# EAGLE design ComparatorLickDet_Alpha1b (EAGLE 9.6.2)
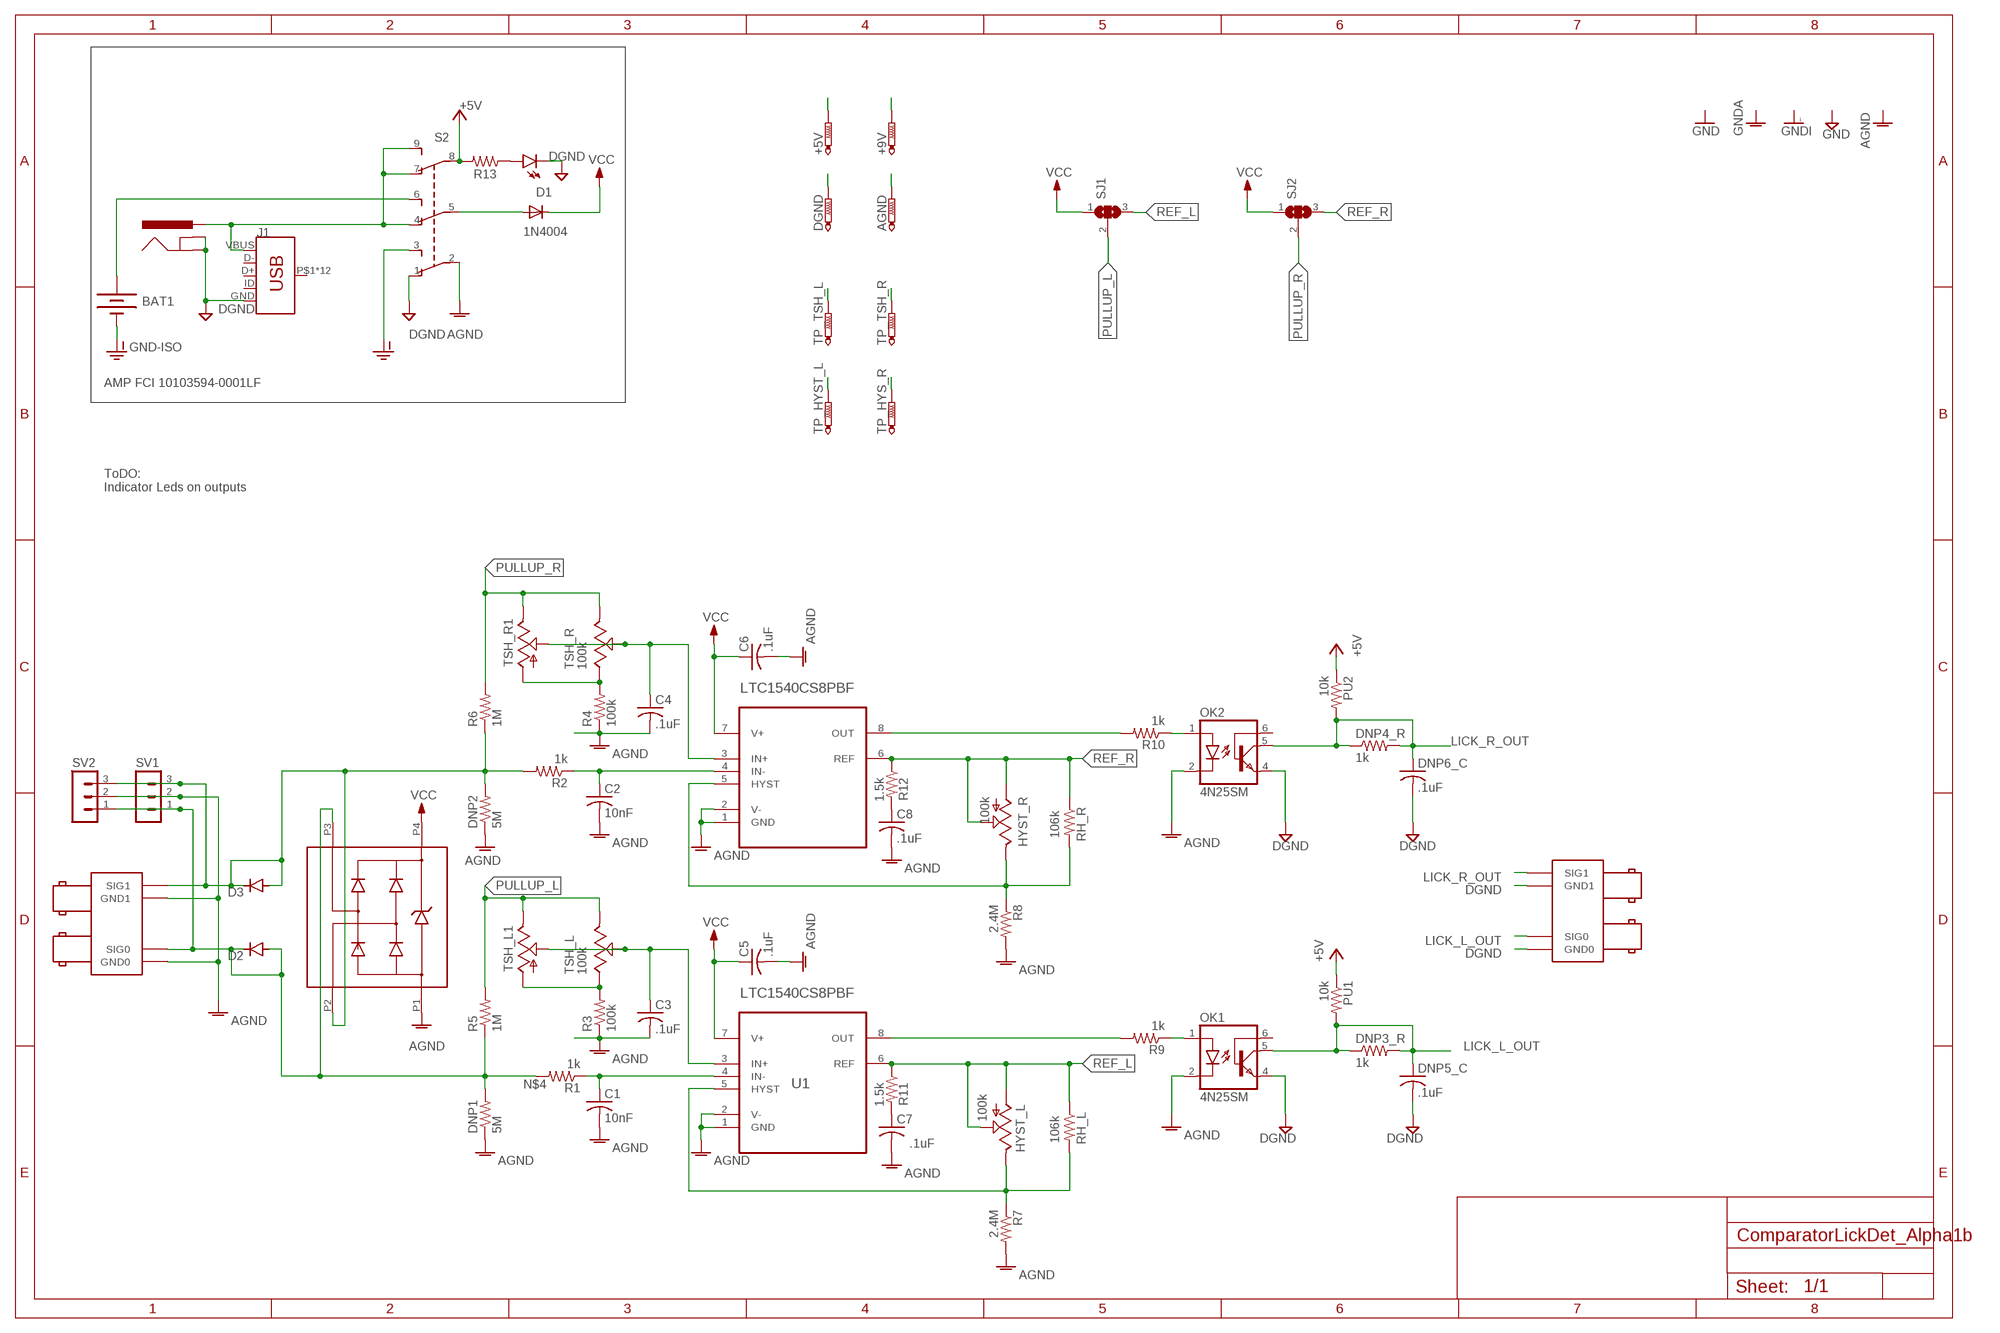
[diagram p0: schematic, sheet 1]

## Parts
+5V  PTR1PAD1-13Y  [P1-13Y]
+9V  PTR1PAD1-13Y  [P1-13Y]
AGND  PTR1PAD1-13Y  [P1-13Y]
BAT1  BATTERY9V  [BATTCON_9V]
C1  10nF  C-USC0805  [C0805]
C2  10nF  C-USC0805  [C0805]
C3  .1uF  C-USC0805  [C0805]
C4  .1uF  C-USC0805  [C0805]
C5  .1uF  C-USC0805  [C0805]
C6  .1uF  C-USC0805  [C0805]
C7  .1uF  C-USC0805  [C0805]
C8  .1uF  C-USC0805  [C0805]
D1  1N4004  [DO41-10]
D2  DIODE-D-2.5  [D-2.5]
D3  DIODE-D-2.5  [D-2.5]
DGND  PTR1PAD1-13Y  [P1-13Y]
DNP1  5M  R-US_M0805  [M0805]
DNP2  5M  R-US_M0805  [M0805]
DNP3_R  1k  R-US_M0805  [M0805]
DNP4_R  1k  R-US_M0805  [M0805]
DNP5_C  .1uF  C-USC0805  [C0805]
DNP6_C  .1uF  C-USC0805  [C0805]
HYST_L  100k  TRIM_US-B25P  [B25P]
HYST_R  100k  TRIM_US-B25P  [B25P]
J1  AMP FCI 10103594-0001LF  USB_MICRO-B_HALF_PTH  [USB-MICROB-PTH]
JP10  POWER_JACKPTH_BREAD  [POWER_JACK_PTH_BREAD]
LICKS_IN  BNC_RIGHT_ANGLE_DOUBLE  [BNC_RIGHT_ANGLE_DOUBLE]
LICKS_OUT  BNC_RIGHT_ANGLE_DOUBLE  [BNC_RIGHT_ANGLE_DOUBLE]
OK1  4N25SM  [DIL6-SMD]
OK2  4N25SM  [DIL6-SMD]
PU1  10k  R-US_M0805  [M0805]
PU2  10k  R-US_M0805  [M0805]
PWR  LED3MM  [LED3MM]
R1  1k  R-US_M0805  [M0805]
R2  1k  R-US_M0805  [M0805]
R3  100k  R-US_M0805  [M0805]
R4  100k  R-US_M0805  [M0805]
R5  1M  R-US_M0805  [M0805]
R6  1M  R-US_M0805  [M0805]
R7  2.4M  R-US_M0805  [M0805]
R8  2.4M  R-US_M0805  [M0805]
R9  1k  R-US_M0805  [M0805]
R10  1k  R-US_M0805  [M0805]
R11  1.5k  R-US_M0805  [M0805]
R12  1.5k  R-US_M0805  [M0805]
R13  330  R-US_R0805  [R0805]
RH_L  106k  R-US_M0805  [M0805]
RH_R  106k  R-US_M0805  [M0805]
S2  SWITCH-3PDT-TH-V  [NKK-M20-9PIN-VERTICAL]
SJ1  SJ2W  [SJ_2]
SJ2  SJ2W  [SJ_2]
SV1  MA03-1  [MA03-1]
SV2  MA03-1  [MA03-1]
TP_HYS_R  PTR1PAD1-13  [P1-13]
TP_HYST_L  PTR1PAD1-13  [P1-13]
TP_TSH_L  PTR1PAD1-13  [P1-13]
TP_TSH_R  PTR1PAD1-13  [P1-13]
TSH_L  100k  3590S-2-103L  [TRIM_3590S-2-103L]
TSH_L1  100k  TRIM_US-B25P  [B25P]
TSH_R  100k  3590S-2-103L  [TRIM_3590S-2-103L]
TSH_R1  100k  TRIM_US-B25P  [B25P]
U1  LTC1540CS8PBF  [SOIC127P600X175-8N]
U2  LTC1540CS8PBF  [SOIC127P600X175-8N]
U3  CD143A-12_TVS  [SOT-143]

## Nets
+5V: +5V.TP PU1.1 PU2.1 R13.2 S2.8(P3)
+9V: +9V.TP BAT1.+ S2.6(S2)
AGND: AGND.TP C1.2 C2.2 C3.2 C4.2 C5.2 C6.2 C7.2 C8.2 DNP1.1 DNP2.1 LICKS_IN.P$GND0(GND0) LICKS_IN.P$GND1(GND1) OK1.2(C) OK2.2(C) R3.1 R4.1 R7.2 R8.2 S2.2(P1) SV1.2 SV2.2 U1.1(GND) U1.2(V-) U2.1(GND) U2.2(V-) U3.P1
DGND: DGND.TP DNP5_C.2 DNP6_C.2 J1.GND JP10.GND JP10.GNDBREAK LICKS_OUT.P$GND0(GND0) LICKS_OUT.P$GND1(GND1) OK1.4(EMI) OK2.4(EMI) PWR.K(C) S2.1(O1) ; supply symbol labelled GND
GND-ISO: BAT1.- S2.3(S1)
HYST_L: HYST_L.E R7.1 RH_L.2 TP_HYST_L.TP U1.5(HYST)
HYST_R: HYST_R.E R8.1 RH_R.2 TP_HYS_R.TP U2.5(HYST)
LICK_L_IN: C1.1 R1.1 U1.4(IN-)
LICK_L_OUT: DNP3_R.1 DNP3_R.2 DNP5_C.1 LICKS_OUT.P$SIG0(SIG0) OK1.5(COL) PU1.2
LICK_R_OUT: DNP4_R.1 DNP4_R.2 DNP6_C.1 LICKS_OUT.P$SIG1(SIG1) OK2.5(COL) PU2.2
N$2: R3.2 TSH_L1.A TSH_L.1(CCW)
N$4: D2.A D2.C DNP1.2 LICKS_IN.P$SIG0(SIG0) R1.2 R5.1 SV1.1 SV2.1 U3.P3
N$6: J1.VBUS JP10.PWR S2.4(O2) S2.7(O3) S2.9(S3)
N$7: C7.1 R11.2
N$8: R4.2 TSH_R1.A TSH_R.1(CCW)
N$9: C2.1 R2.1 U2.4(IN-)
N$10: C8.1 R12.2
N$11: D3.A D3.C DNP2.2 LICKS_IN.P$SIG1(SIG1) R2.2 R6.1 SV1.3 SV2.3 U3.P2
N$21: PWR.A R13.1
N$26: OK1.1(A) R9.1
N$31: R9.2 U1.8(OUT)
N$46: OK2.1(A) R10.1
N$47: R10.2 U2.8(OUT)
PULLUP_L: R5.2 SJ1.2 TSH_L1.E TSH_L.3(CW)
PULLUP_R: R6.2 SJ2.2 TSH_R1.E TSH_R.3(CW)
REF_L: HYST_L.A HYST_L.S R11.1 RH_L.1 SJ1.3 U1.6(REF)
REF_R: HYST_R.A HYST_R.S R12.1 RH_R.1 SJ2.3 U2.6(REF)
TSH_L: C3.1 TP_TSH_L.TP TSH_L1.S TSH_L.2(WIPER) U1.3(IN+)
TSH_R: C4.1 TP_TSH_R.TP TSH_R1.S TSH_R.2(WIPER) U2.3(IN+)
VCC: C5.1 C6.1 D1.C SJ1.1 SJ2.1 U1.7(V+) U2.7(V+) U3.P4
VIN: D1.A S2.5(P2)
Unconnected: J1.D+ J1.D- J1.ID J1.P$1(SHIELD) J1.P$2(SHIELD) J1.P$3(SHIELD) J1.P$4(SHIELD) J1.P$6(SHIELD) J1.P$8(SHIELD) J1.P$10(SHIELD) J1.P$12(SHIELD) J1.SHEILD2(SHIELD) J1.SHIELD J1.SHIELD3(SHIELD) J1.SHIELD4(SHIELD) OK1.6(BAS) OK2.6(BAS)

## Notes on the sheet
- ToDO:
  Indicator Leds on outputs

## Library data of the parts
+5V +9V AGND DGND TP_HYS_R TP_HYST_L TP_TSH_L TP_TSH_R = testpad:PTR1: TEST PIN
BAT1 = Pavel_ElectroMechanical:BATTERY: Battery Holders Various common sizes : AA, AAA, 18650 (PRT-12895), 20mm coin cell and 12mm coin cell. 20MM_4LEGS, BATT-10373 9V Digikey BH9v-PC-ND
C1-C8 DNP6_C = adafruit:C-US: CAPACITOR, American symbol; SPICEPREFIX: C
D1 = adafruit:1N4004: DIODE General purpose 1N400x type rectifier (With bigger pads) http://www.ladyada.net/library/pcb/eaglelibrary.html
D2 D3 = diode:DIODE-: DIODE
DNP1 DNP2 DNP4_R PU2 R1-R6 R8 R10 = adafruit:R-US_: RESISTOR, American symbol; SPICEPREFIX: R
DNP3_R PU1 R7 R9 R11-R13 RH_L RH_R = adafruit:R-US_: RESISTOR, American symbol
DNP5_C = adafruit:C-US: CAPACITOR, American symbol
HYST_L TSH_L1 TSH_R1 = pot:TRIM_US-: POTENTIOMETER
HYST_R = pot:TRIM_US-: POTENTIOMETER; SPICEPREFIX: J
J1 = SparkFun-Connectors:USB_MICRO-B: USB Type Micro-B Connector Male/female and PTH/SMT variants SparkFun Products: SparkFun microB USB Breakout <https://www.sparkfun.com/products/12035> SparkFun USB microB Plug Breakout <https://www.sparkfun.com/products/10031> SparkFun ESP8266 Thing <https://www.sparkfun.com/products/13231>; PROD_ID: CONN-13711
JP10 = SparkFun-Connectors:POWER_JACK: Power Jack Connector This is the standard 5.5mm barrel jack for power. The PTH is the most common, proven, reliable, footprint. The Slot footprint only works if the mill layer is transmitted to the PCB fab house so be warned. Here are the connectors we sell at SparkFun: DC Barrel Power Jack/Connector <https://www.sparkfun.com/products/119> (PRT-00119) DC Barrel Power Jack/Connector (SMD) <https://www.sparkfun.com/products/12748> (PRT-12748) DC Barrel Jack Adapter - Breadboard Compatible <https://www.sparkfun.com/products/10811> (PRT-10811) It is used on this SparkFun product (and many, many others): SparkFun RedBoard - Programmed with Arduino <https://www.sparkfun.com/products/12757> (DEV-12757) Also, if you need a mating power supply or connector, please check these out: Wall Adapter Power Supply - 9VDC 650mA <https://www.sparkfun.com/products/298> (TOL-00298) DC Barrel Jack Adapter - Male <https://www.sparkfun.com/products/10287> (PRT-10287); PROD_ID: PRT-10811
LICKS_IN LICKS_OUT = Pavel_Connectors:BNC_RIGHT_ANGLE_DOUBLE
OK1 = optocoupler:4N*?M: General Purpose 6-Pin Phototransistor Optocouplers Source: http://www.fairchildsemi.com/ds/4N/4N35-M.pdf; MF: FAIRCHILD SEMICONDUCTOR; MPN: 4N25SM; OC_FARNELL: 1021152; OC_NEWARK: 34C2020
OK2 = optocoupler:4N*?M: General Purpose 6-Pin Phototransistor Optocouplers Source: http://www.fairchildsemi.com/ds/4N/4N35-M.pdf; MF: FAIRCHILD SEMICONDUCTOR; MPN: 4N25SM; OC_FARNELL: 1021152; OC_NEWARK: 34C2020; SPICEPREFIX: X
PWR = led:LED: LED OSRAM: - CHIPLED LG R971, LG N971, LY N971, LG Q971, LY Q971, LO R971, LY R971 LH N974, LH R974 LS Q976, LO Q976, LY Q976 LO Q996 - Hyper CHIPLED LW Q18S LB Q993, LB Q99A, LB R99A - SideLED LS A670, LO A670, LY A670, LG A670, LP A670 LB A673, LV A673, LT A673, LW A673 LH A674 LY A675 LS A676, LA A676, LO A676, LY A676, LW A676 LS A679, LY A679, LG A679 - Hyper Micro SIDELED® LS Y876, LA Y876, LO Y876, LY Y876 LT Y87S - SmartLED LW L88C, LW L88S LB L89C, LB L89S, LG L890 LS L89K, LO L89K, LY L89K LS L896, LA L896, LO L896, LY L896 - TOPLED LS T670, LO T670, LY T670, LG T670, LP T670 LSG T670, LSP T670, LSY T670, LOP T670, LYG T670 LG T671, LOG T671, LSG T671 LB T673, LV T673, LT T673, LW T673 LH T674 LS T676, LA T676, LO T676, LY T676, LB T676, LH T676, LSB T676, LW T676 LB T67C, LV T67C, LT T67C, LS T67K, LO T67K, LY T67K, LW E67C LS E67B, LA E67B, LO E67B, LY E67B, LB E67C, LV E67C, LT E67C LW T67C LS T679, LY T679, LG T679 LS T770, LO T770, LY T770, LG T770, LP T770 LB T773, LV T773, LT T773, LW T773 LH T774 LS E675, LA E675, LY E675, LS T675 LS T776, LA T776, LO T776, LY T776, LB T776 LHGB T686 LT T68C, LB T68C - Hyper Mini TOPLED® LB M676 - Mini TOPLED Santana® LG M470 LS M47K, LO M47K, LY M47K Source: http://www.osram.convergy.de LUXEON: - LUMILED® LXK2-PW12-R00, LXK2-PW12-S00, LXK2-PW14-U00, LXK2-PW14-V00 LXK2-PM12-R00, LXK2-PM12-S00, LXK2-PM14-U00 LXK2-PE12-Q00, LXK2-PE12-R00, LXK2-PE12-S00, LXK2-PE14-T00, LXK2-PE14-U00 LXK2-PB12-K00, LXK2-PB12-L00, LXK2-PB12-M00, LXK2-PB14-N00, LXK2-PB14-P00, LXK2-PB14-Q00 LXK2-PR12-L00, LXK2-PR12-M00, LXK2-PR14-Q00, LXK2-PR14-R00 LXK2-PD12-Q00, LXK2-PD12-R00, LXK2-PD12-S00 LXK2-PH12-R00, LXK2-PH12-S00 LXK2-PL12-P00, LXK2-PL12-Q00, LXK2-PL12-R00 Source: www.luxeon.com KINGBRIGHT: KA-3528ASYC Source: www.kingbright.com
S2 = Pavel_ElectroMechanical:SWITCH-3PDT-TH-V: 3PDT 9 pin footswitch SF17020F-0302-21R-L Source: 3PDT.jpg
SJ1 SJ2 = jumper:SJ2W: SMD solder JUMPER
SV1 SV2 = con-lstb:MA03-1: PIN HEADER; OC_FARNELL: unknown; OC_NEWARK: unknown
TSH_L TSH_R = 3590S-2-103L:3590S-2-103L: Res Wirewound POT 10K Ohm 5% 2W 10(Elec)/10(Mech)Turn 6.34mm (39.22 X 22.23 X 26.66mm) Solder Lug Panel Mount Check availability <https://pricing.snapeda.com/parts/3590S-2-103L/Bourns/view-part?ref=eda>; AVAILABILITY: In Stock; DESCRIPTION: 10k Ohm 1 Gang Linear Panel Mount Potentiometer None 10.0 Kierros Wirewound 2W Solder Lug; MF: Bourns; MP: 3590S-2-103L; PACKAGE: SOT-23 Bourns; PRICE: None; PURCHASE-URL: https://pricing.snapeda.com/search?q=3590S-2-103L&ref=eda
U1 = LTC1540CS8PBF:LTC1540CS8PBF: 12-Bit Rail-to-Rail Micropower DACs; AVAILABILITY: Unavailable; DESCRIPTION: Comparator Single ±5.5 Volt 11 Volt 8-Pin SOIC N; MF: Linear Technology/Analog; MP: LTC1540CS8#PBF; PACKAGE: SO-8 Linear Technology; PRICE: None
U2 = LTC1540CS8PBF:LTC1540CS8PBF: 12-Bit Rail-to-Rail Micropower DACs; AVAILABILITY: Unavailable; DESCRIPTION: Comparator Single ±5.5 Volt 11 Volt 8-Pin SOIC N; MF: Linear Technology/Analog; MP: LTC1540CS8#PBF; PACKAGE: SO-8 Linear Technology; PRICE: None; SPICEPREFIX: X
U3 = Pavel_ICs:CD143A-12_TVS: Bourns TVS Array for data line protection DigiKey PN CD143A-SR12CT-ND

## Net classes
1 power: width 0.508 mm

## Board
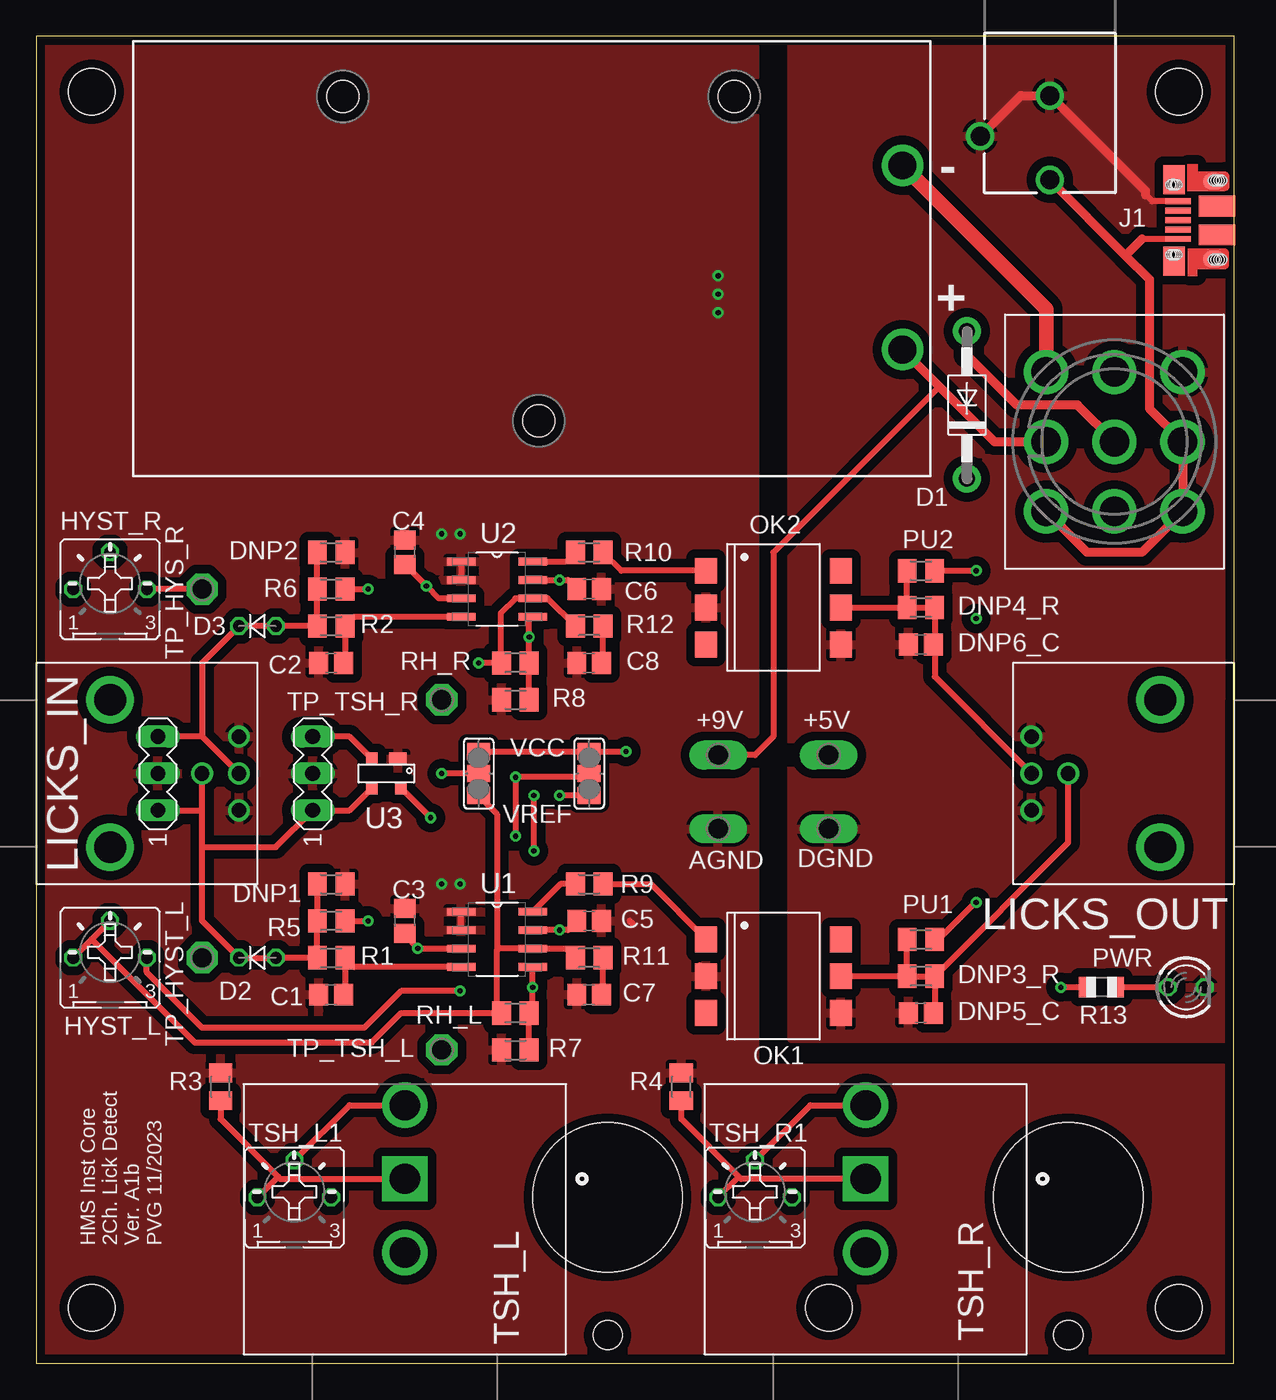
[diagram p1: board, top side]
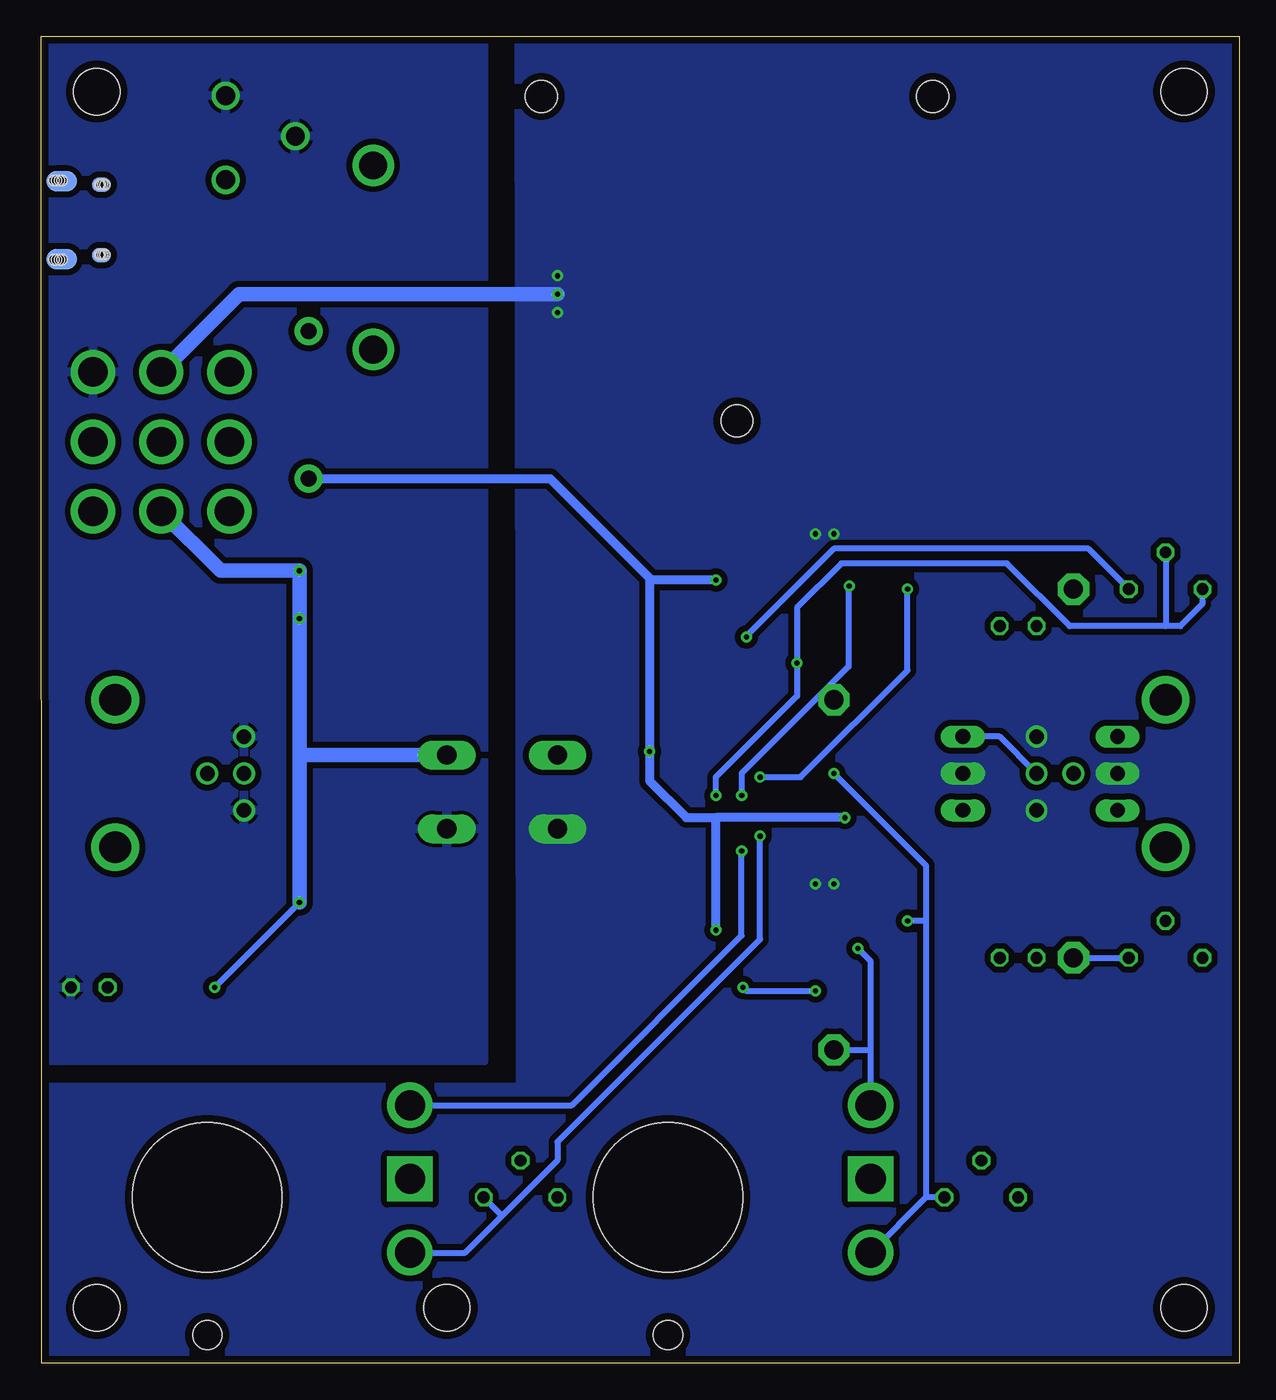
[diagram p2: board, bottom side, seen from below]

Size 82.55 x 91.44 mm. Coordinates in mm from the lower left corner, seen from the top.
Outline: 0,0 82.53,0 82.55,91.44 0,91.44 0,0
Copper layers (1*16): Top 0.0178mm / dielectric 59mil / Bottom 0.0178mm
Design rules "SSC-EAGLE-2Lyr_v1.0.0.3": minimum track width 6mil, minimum drill 14mil, track to track 6mil, track to pad 6mil, pad to pad 6mil, via to via 6mil, smd to smd 6mil, copper to edge 20mil, drill to drill 16mil, minimum pad ring 8mil, minimum via ring 8mil, stop-mask expansion 3mil, vias tented up to drill 0mil, thermal gap 10mil
Holes 3.2 mm at 3.81,3.81 78.74,3.81 78.74,87.63 3.81,87.63 54.61,3.81
Holes 10.29 mm at 39.37,11.43 71.12,11.43
Holes 2.01 mm at 39.37,1.93 71.12,1.93

### Footprints (pad centres in the part's own frame; a part is rotated, then mirrored left to right if it is on the bottom)
P1-13Y = drill 1.321 pad 1.905 long: TP 0,0
BATTCON_9V = drill 1.905: + 0,-12.7; - 0,0 | hole 2.2: -11.582,4.75; -38.557,4.75; -25.07,-17.602
C0805 = smd 1.3 x 1.5: 1 -0.85,0; 2 0.85,0
DO41-10 = drill 1.118 pad 1.93: A 5.08,0; C -5.08,0
D-2.5 = drill 0.813 octagon: A 1.27,0; C -1.27,0
M0805 = smd 1.3 x 1.6: 1 -0.95,0; 2 0.95,0
B25P = drill 0.813 octagon: A -2.54,0; E 2.54,0; S 0,2.54
USB-MICROB-PTH = smd 0.4 x 1.75: D+ 0.031,1.331; D- -0.619,1.331; GND 1.331,1.331; ID 0.681,1.331; VBUS -1.269,1.331 | smd 1.4 x 2.1 bottom: P$1 2.701,-1.142; P$3 -2.659,-1.144 | smd 1 x 1.3: P$2 2.487,1.594; P$6 -2.368,1.604 | smd 1 x 1.3 bottom: P$4 -2.368,1.604; P$10 2.481,1.598 | smd 1.1 x 1.5: P$8 2.701,-1.142; P$12 -2.659,-1.144 | smd 2 x 1.46: SHEILD2 2.831,1.606; SHIELD -2.794,1.606 | smd 1.425 x 2.5: SHIELD3 -0.979,-1.349; SHIELD4 0.996,-1.352 | hole 0.7: -2.693,-1.134; -2.693,-1.3; -2.694,-1.499; -2.694,-1.664; 2.768,-1.134; 2.767,-1.303; 2.766,-1.496; 2.766,-1.664 | hole 0.66: -2.359,1.821; -2.349,1.691; -2.359,1.541; -2.354,1.432; 2.481,1.821; 2.491,1.691; 2.481,1.541; 2.486,1.432
POWER_JACK_PTH_BREAD = drill 1.3: GND 0,7.9; GNDBREAK 4.8,10.7; PWR 0,13.7
BNC_RIGHT_ANGLE_DOUBLE = drill 2.2: P$1 0,-5.08; P$2 0,5.08 | drill 1: P$GND0 8.89,-2.54; P$GND1 8.89,2.54; P$SIG0 6.35,0; P$SIG1 8.89,0
DIL6-SMD = smd 1.78 x 1.52: 1 -2.54,-4.645; 2 0,-4.645; 3 2.54,-4.645; 4 2.54,4.645; 5 0,4.645; 6 -2.54,4.645
LED3MM = drill 0.813 octagon: A -1.27,0; K 1.27,0
R0805 = smd 1.1 x 1.4: 1 -1,0; 2 1,0
NKK-M20-9PIN-VERTICAL = drill 2.032: 1 -4.801,4.699; 2 -4.801,0; 3 -4.801,-4.699; 4 0,4.699; 5 0,0; 6 0,-4.699; 7 4.801,4.699; 8 4.801,0; 9 4.801,-4.699
SJ_2 = smd 1.168 x 1.6: 1 -1.524,0; 2 0,0; 3 1.524,0
MA03-1 = drill 1.016 long: 1 -2.54,0; 2 0,0; 3 2.54,0
P1-13 = drill 1.321 pad 2.159 octagon: TP 0,0
TRIM_3590S-2-103L = drill 2.08 square: 1 0,0 | drill 2.08: 2 -5.08,0; 3 5.08,0
SOIC127P600X175-8N = smd 1.981 x 0.533: 1 -2.464,1.905; 2 -2.464,0.635; 3 -2.464,-0.635; 4 -2.464,-1.905; 5 2.464,-1.905; 6 2.464,-0.635; 7 2.464,0.635; 8 2.464,1.905
SOT-143 = smd 0.9 x 1.2: P1 -1,0.8 | smd 0.9 x 0.8: P2 -1,-1; P3 1,-1; P4 1,1

### Placement (x,y rotation side)
+5V  54.61,41.91 90 top
+9V  46.99,41.91 90 top
AGND  46.99,36.83 90 top
BAT1  59.69,82.55 0 top
C1  20.32,25.4 180 top
C2  20.32,48.26 180 top
C3  25.4,30.48 90 top
C4  25.4,55.88 90 top
C5  38.1,30.48 0 top
C6  38.1,53.34 0 top
C7  38.1,25.4 180 top
C8  38.1,48.26 180 top
D1  64.14,66.04 90 top
D2  15.24,27.94 0 top
D3  15.24,50.8 0 top
DGND  54.61,36.83 90 top
DNP1  20.32,33.02 180 top
DNP2  20.32,55.88 180 top
DNP3_R  60.96,26.67 0 top
DNP4_R  60.96,52.07 0 top
DNP5_C  60.96,24.13 180 top
DNP6_C  60.96,49.53 180 top
HYST_L  5.08,27.94 0 top
HYST_R  5.08,53.34 0 top
J1  80.01,78.74 90 top
JP10  69.85,95.25 180 top
LICKS_IN  5.08,40.64 0 top
LICKS_OUT  77.47,40.64 180 top
OK1  50.8,26.67 270 top
OK2  50.8,52.07 270 top
PU1  60.96,29.21 180 top
PU2  60.96,54.61 180 top
PWR  79.25,25.91 0 top
R1  20.32,27.94 180 top
R2  20.32,50.8 180 top
R3  12.7,19.05 270 top
R4  44.45,19.05 270 top
R5  20.32,30.48 0 top
R6  20.32,53.34 0 top
R7  33.02,21.59 180 top
R8  33.02,45.72 180 top
R9  38.1,33.02 180 top
R10  38.1,55.88 180 top
R11  38.1,27.94 0 top
R12  38.1,50.8 0 top
R13  73.41,25.91 180 top
RH_L  33.02,24.13 0 top
RH_R  33.02,48.26 0 top
S2  74.3,63.5 270 top
SJ1  30.48,40.64 270 top
SJ2  38.1,40.64 270 top
SV1  8.38,40.64 90 top
SV2  19.05,40.64 90 top
TP_HYS_R  11.43,53.34 90 top
TP_HYST_L  11.43,27.94 0 top
TP_TSH_L  27.94,21.59 0 top
TP_TSH_R  27.94,45.72 0 top
TSH_L  25.4,12.7 270 top
TSH_L1  17.78,11.43 0 top
TSH_R  57.15,12.7 270 top
TSH_R1  49.53,11.43 0 top
U1  31.75,29.21 0 top
U2  31.75,53.34 0 top
U3  24.13,40.64 270 top

### Tracks (layer width: path | path; a pad name or v marks a point on that pad's centre or on a via)
+5V  (via drill 0.36)
  Top 0.406: PU2.1 v64.77,54.61 | PU1.1 62.16,29.21 64.7,31.75 v64.77,31.75 | R13.2 72.39,25.89 70.63,25.89 v70.61,25.91
  Bottom 0.406: v70.61,25.91 v64.77,31.75
  Bottom 1.016: S2.8 70.21,54.61 v64.77,54.61 v64.77,51.31 64.77,41.91 | 64.77,41.91 v64.77,31.75 | +5V.TP 64.77,41.91
+9V
  Top 0.406: 62.23,67.31 50.8,55.88 50.8,43.18 49.53,41.91 +9V.TP
  Top 0.61: BAT1.+ 62.23,67.31 66.04,63.5 S2.6
AGND  (via drill 0.36)
  Top 0.406: U2.1 U2.2 | U1.2 U1.1 | OK1.2 46.16,26.98 45.72,27.43 | 41.15,30.23 40.89,30.48
  Bottom 1.016: S2.2 68.94,73.66 v46.99,73.66
  other vias: 27.94,57.15 29.21,57.15 27.94,33.02 29.21,33.02 46.99,74.93 46.99,72.39
  pour Top (isolate 0.61, rank 2): 49.53,93.56 -3.81,94.01 -3.81,-2.54 85.09,-2.54 85.09,20.32 49.53,20.32
  pour Bottom (isolate 0.406, no thermals): -1.27,-3.81 85.09,-3.81 85.09,19.05 49.53,19.05 49.53,21.59 49.62,93.29 -1.27,93.29
DGND
  Top 0.406: J1.GND 76.9,80.07 76.45,80.52
  Top 0.61: JP10.GNDBREAK 67.85,87.35 JP10.GND 69.88,87.35 76.45,80.77 76.45,80.52
  pour Bottom (isolate 0.406, rank 2): 52.07,20.83 85.08,20.83 85.06,93.98 52.07,93.98
  pour Top (isolate 0.61, rank 3): 52.07,22.35 52.07,95.25 85.09,95.25 85.09,22.35
GND-ISO
  Top 1.016: S2.3 69.6,72.64 BAT1.-
HYST_L  (via drill 0.36)
  Top 0.406: R7.1 RH_L.2 34.21,24.37 v34.21,25.91 U1.5 | v29.21,25.65 25.15,25.65 22.61,23.11 11.43,23.11 7.62,26.92 HYST_L.E
  Bottom 0.406: v34.21,25.91 33.96,25.65 v29.21,25.65 | TP_HYST_L.TP HYST_L.E
HYST_R  (via drill 0.36)
  Top 0.406: U2.5 33.97,51.19 v33.97,50.04 RH_R.2 R8.1 | TP_HYS_R.TP HYST_R.E
  Bottom 0.406: HYST_R.E 10.41,56.13 27.94,56.13 33.97,50.1 v33.97,50.04
LICK_L_IN
  Top 0.406: C1.1 21.27,25.5 R1.1 21.91,27.3 U1.4
LICK_L_OUT
  Top 0.406: DNP3_R.2 61.91,24.23 DNP5_C.1 | DNP3_R.2 71.12,35.88 LICKS_OUT.P$SIG0 | DNP3_R.1 OK1.5 | DNP3_R.1 PU1.2 | DNP3_R.1 DNP3_R.2
LICK_R_OUT
  Top 0.406: 61.91,49.63 DNP4_R.2 DNP4_R.1 | 61.91,49.63 61.91,47.31 LICKS_OUT.P$SIG1 | 61.91,49.63 DNP6_C.1 | OK2.5 DNP4_R.1 | DNP4_R.1 PU2.2
N$2
  Top 0.406: R3.2 12.7,16.83 16.67,12.86 | 16.67,12.86 16.83,12.7 TSH_L.1 | TSH_L1.A 16.67,12.86
N$4
  Top 0.406: 11.43,35.56 11.43,30.48 D2.C D2.A R1.2 R5.1 DNP1.2 | 11.43,35.56 11.43,38.1 | 11.43,38.1 LICKS_IN.P$SIG0 | SV1.1 11.43,38.1 | 11.43,35.56 16.51,35.56 SV2.1 21.59,38.1 U3.P3
N$6
  Top 0.406: J1.VBUS 76.2,77.47
  Top 0.61: S2.9 72.42,55.88 76.17,55.88 S2.7 S2.4 76.71,65.79 76.71,74.69 75.06,76.33 | JP10.PWR 75.06,76.33 | 76.2,77.47 75.06,76.33
N$7
  Top 0.406: C7.1 39.05,25.5 R11.2
N$8
  Top 0.406: 48.42,12.86 44.45,16.83 R4.2 | TSH_R1.A 48.42,12.86 | 48.42,12.86 48.58,12.7 TSH_R.1
N$9
  Top 0.406: C2.1 21.27,48.36 R2.1 21.91,51.44 U2.4
N$10
  Top 0.406: C8.1 39.05,48.36 R12.2
N$11
  Top 0.406: LICKS_IN.P$SIG1 11.43,43.18 | 11.43,43.18 SV1.3 | U3.P2 21.59,43.18 SV2.3 | 11.43,43.18 11.43,48.26 D3.C D3.A R2.2 R6.1 DNP2.2
  Bottom 0.406: LICKS_IN.P$SIG1 16.51,43.18 SV2.3
N$21
  Top 0.406: PWR.A R13.1
N$26
  Top 0.406: R9.1 42.34,33.02 OK1.1
N$31
  Top 0.406: R9.2 36.12,33.02 U1.8
N$46
  Top 0.406: OK2.1 40.32,54.61 R10.1
N$47
  Top 0.406: R10.2 36.52,55.24 U2.8
PULLUP_L  (via drill 0.36)
  Top 0.406: R5.2 v22.86,30.48 | SJ1.2 v27.94,40.64
  Bottom 0.406: TSH_L.3 21.59,11.43 | 21.59,30.48 21.59,11.43 | v27.94,40.64 21.59,34.29 21.59,30.48 | 21.59,30.48 v22.86,30.48 | TSH_L1.E 21.59,11.43
PULLUP_R  (via drill 0.36)
  Top 0.406: R6.2 v22.86,53.34 | SJ2.2 37.85,40.39 v33.02,40.39 v33.02,36.32
  Bottom 0.406: v33.02,40.39 30.23,40.39 22.86,47.75 v22.86,53.34 | TSH_R.3 53.34,7.62 50.8,10.16 | v33.02,36.32 33.02,29.21 46.99,15.24 46.99,13.97 50.8,10.16 | TSH_R1.E 50.8,10.16
REF_L
  Top 0.406: R11.1 36.52,28.57 U1.6 31.88,28.57 31.75,28.45 | 31.75,28.45 31.75,24.13 RH_L.1 25.15,24.13 23.11,22.1 10.92,22.1 3.81,29.21 | SJ1.3 31.75,37.85 31.75,28.45 | HYST_L.A 3.81,29.21 | 3.81,29.21 HYST_L.S
REF_R  (via drill 0.36)
  Top 0.406: R12.1 35.24,52.7 U2.6 33.02,52.7 32,51.69 32,48.33 RH_R.1 v30.48,48.26 | SJ2.3 v36.07,39.12
  Bottom 0.406: v36.07,39.12 36.07,40.39 30.48,45.97 v30.48,48.26 30.48,52.07 27.43,55.12 16,55.12 11.68,50.8 5.08,50.8 | HYST_R.A 2.54,52.32 4.06,50.8 5.08,50.8 | HYST_R.S 5.08,50.8
TSH_L  (via drill 0.36)
  Top 0.406: U1.3 v26.29,28.57 25.4,29.46 C3.1 | TSH_L1.S 21.59,17.78 TSH_L.2
  Bottom 0.406: TSH_L.2 25.4,21.59 | 25.4,21.59 25.4,27.69 v26.29,28.57 | TP_TSH_L.TP 25.4,21.59
TSH_R  (via drill 0.36)
  Top 0.406: U2.3 27.73,52.7 v26.88,53.55 C4.1 | v34.29,35.31 v34.29,39.12 | TSH_R1.S 53.34,17.78 TSH_R.2
  Bottom 0.406: TSH_R.2 45.97,17.78 34.29,29.46 v34.29,35.31 | v26.88,53.55 26.92,53.51 26.92,48.01 28.57,46.35 | v34.29,39.12 34.29,40.64 28.57,46.35 | TP_TSH_R.TP 28.57,46.35
VCC  (via drill 0.36)
  Top 0.406: C5.1 36.62,29.84 v36.07,29.84 U1.7 | U2.7 v36.07,53.98 36.62,53.98 C6.1 | SJ2.1 v40.64,42.16 SJ1.1 | U3.P4 v27.18,37.59
  Bottom 0.406: 40.51,53.98 40.64,54.1
  Bottom 0.61: v27.18,37.59 36.07,37.59 | 36.07,37.59 38.1,37.59 40.64,40.13 v40.64,42.16 40.64,54.1 47.5,60.96 D1.C | v36.07,53.98 40.51,53.98 | v36.07,29.84 36.07,37.59
VIN
  Top 0.61: S2.5 71.75,66.04 67.56,66.04 64.14,69.47 D1.A

### Text on the board
tPlace: - | + | VCC | VREF | HMS Inst Core / 2Ch. Lick Detect / Ver. A1b / PVG 11/2023